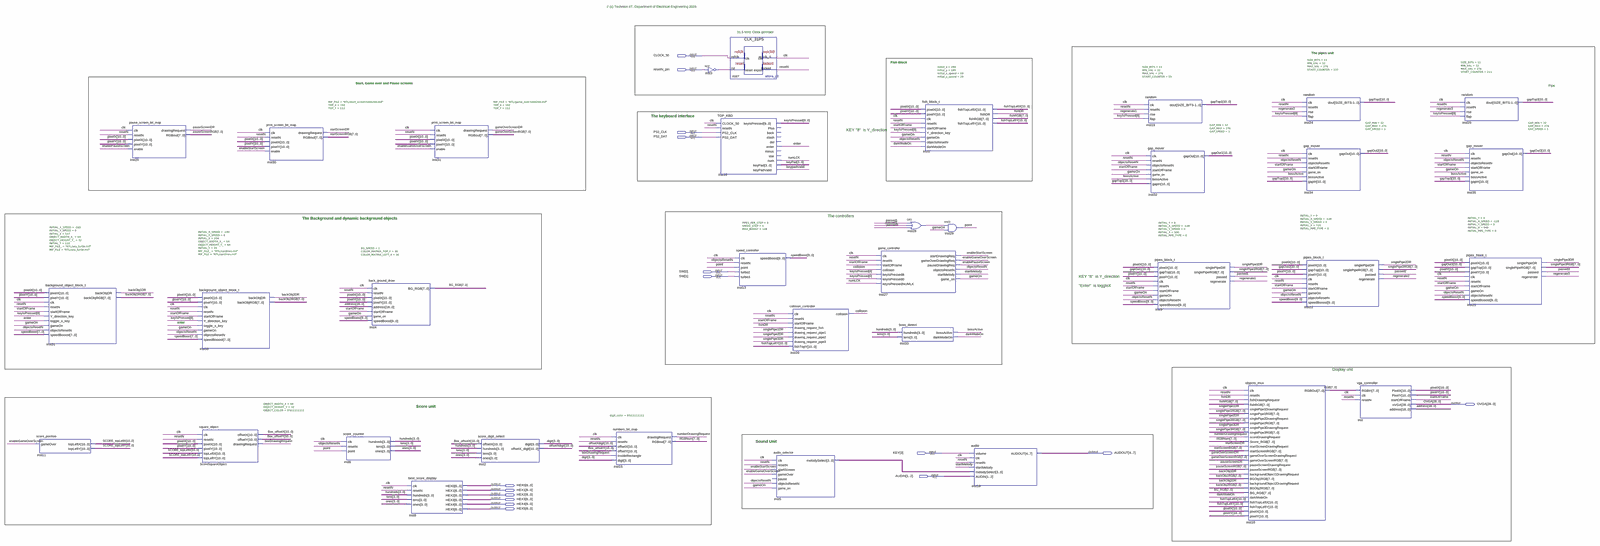
[diagram p0: schematic sheet, whole]
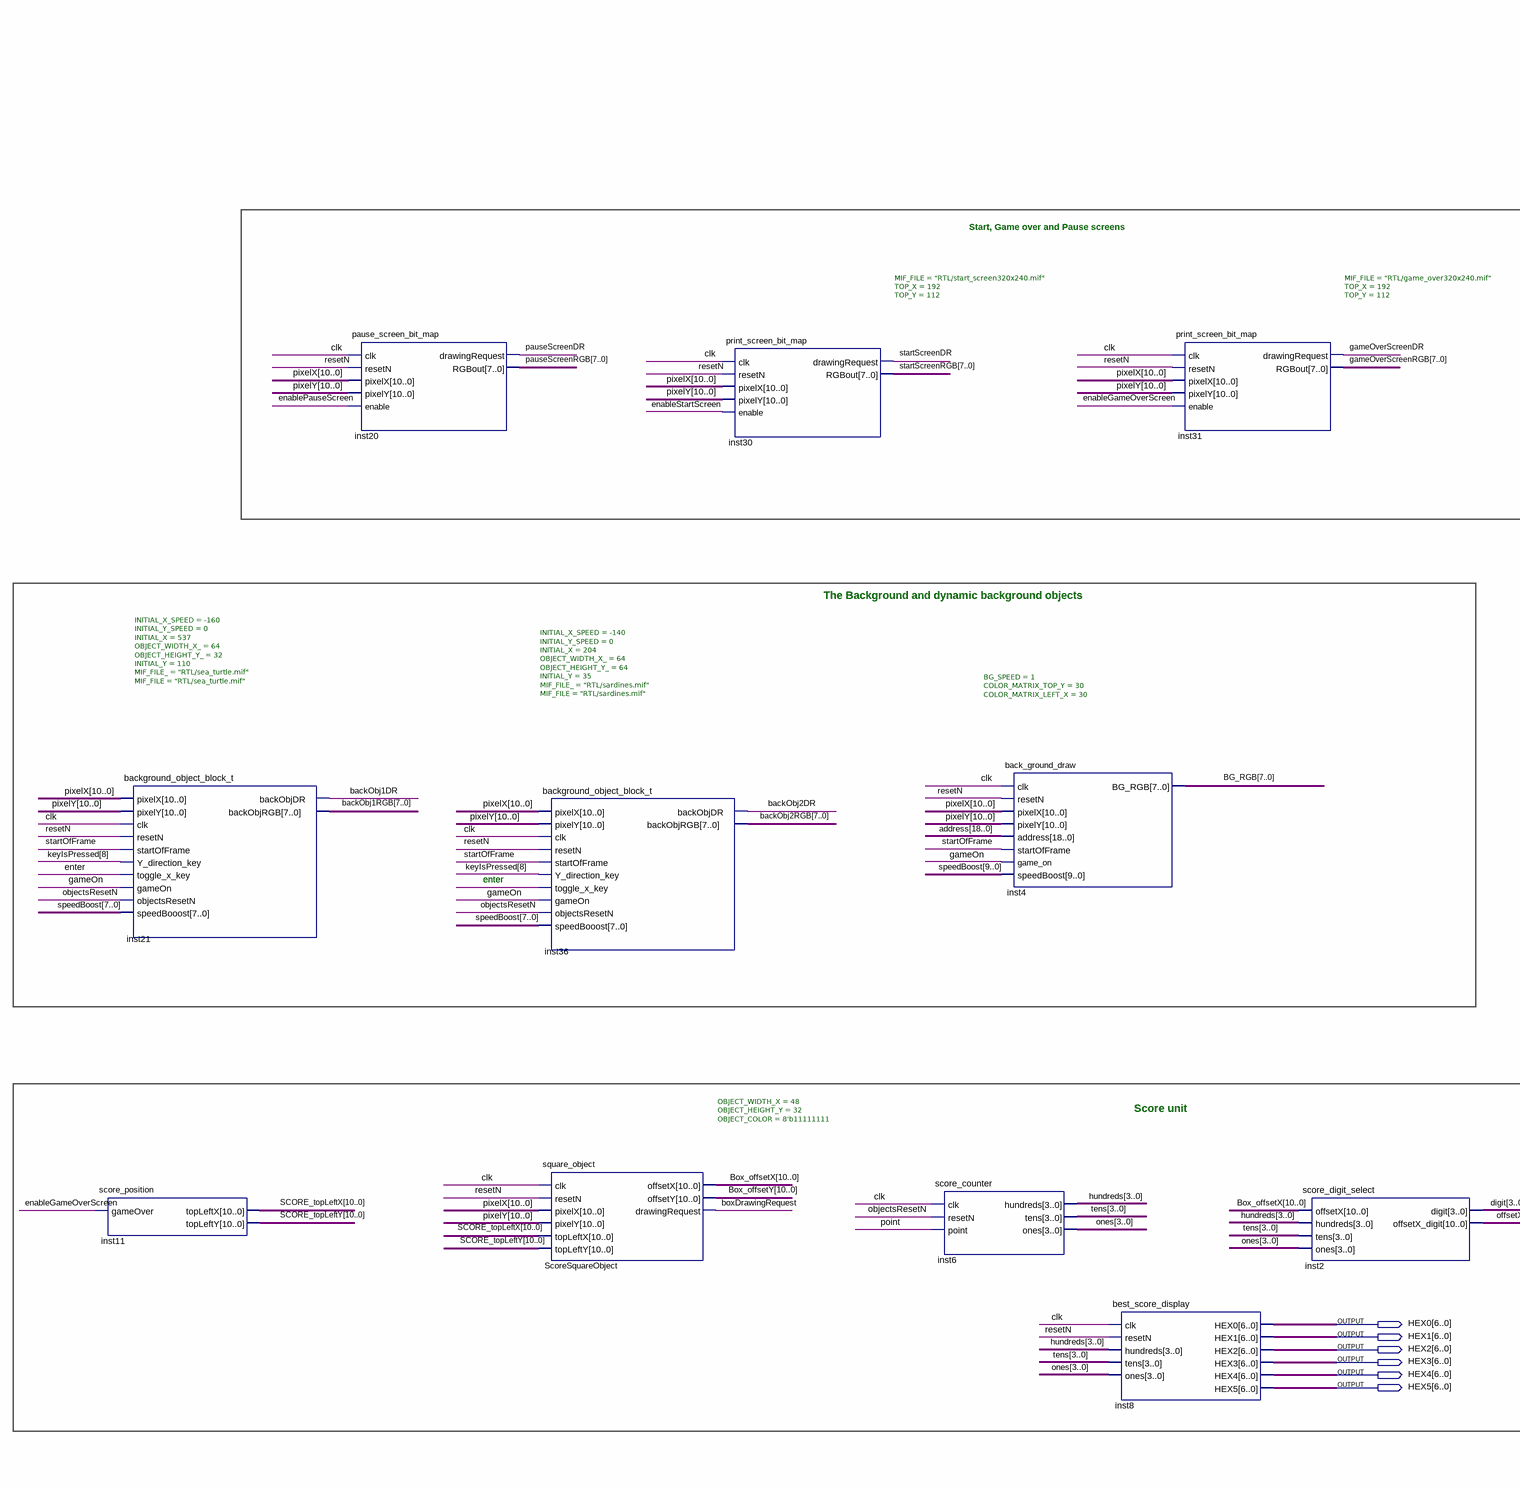
[diagram p1: schematic sheet, left part]
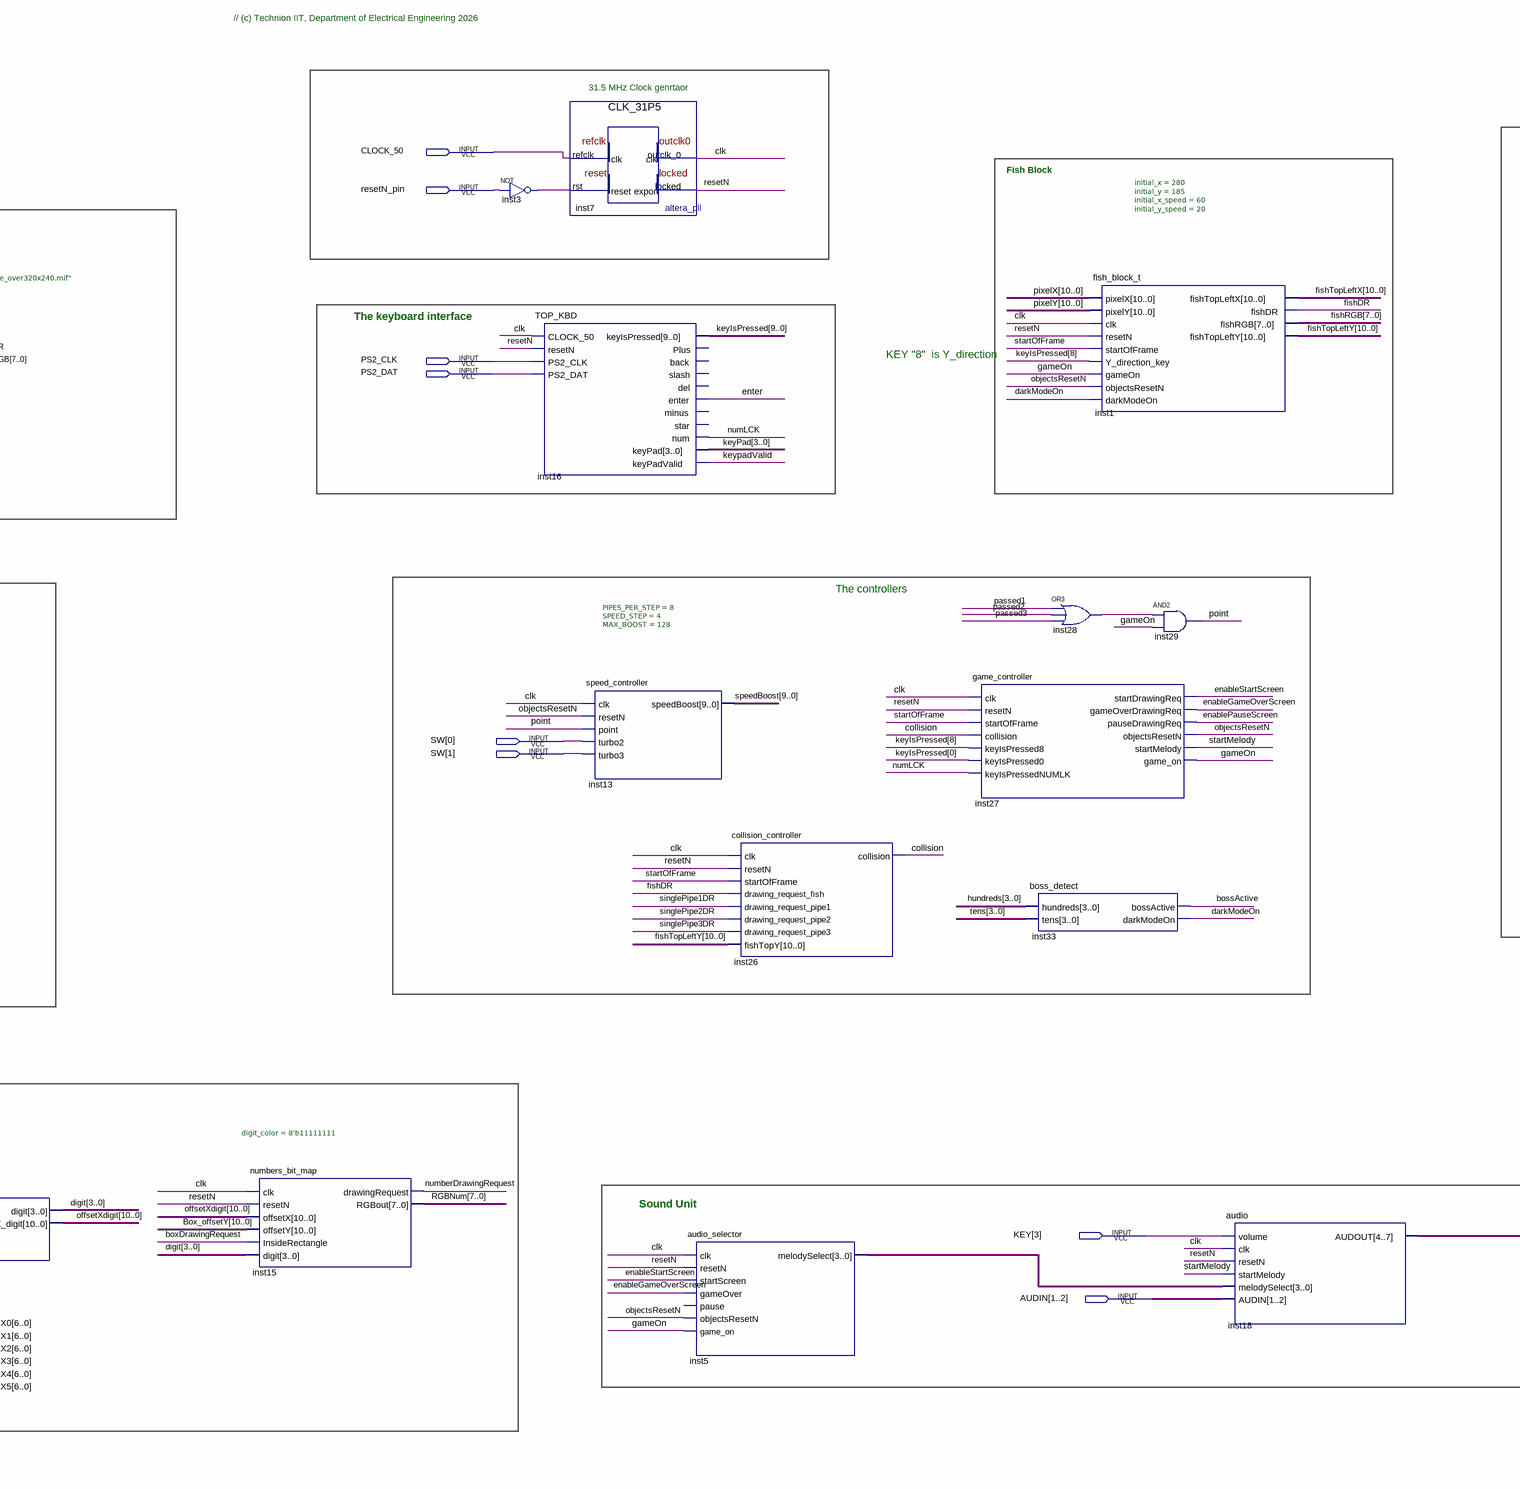
[diagram p2: schematic sheet, centre part]
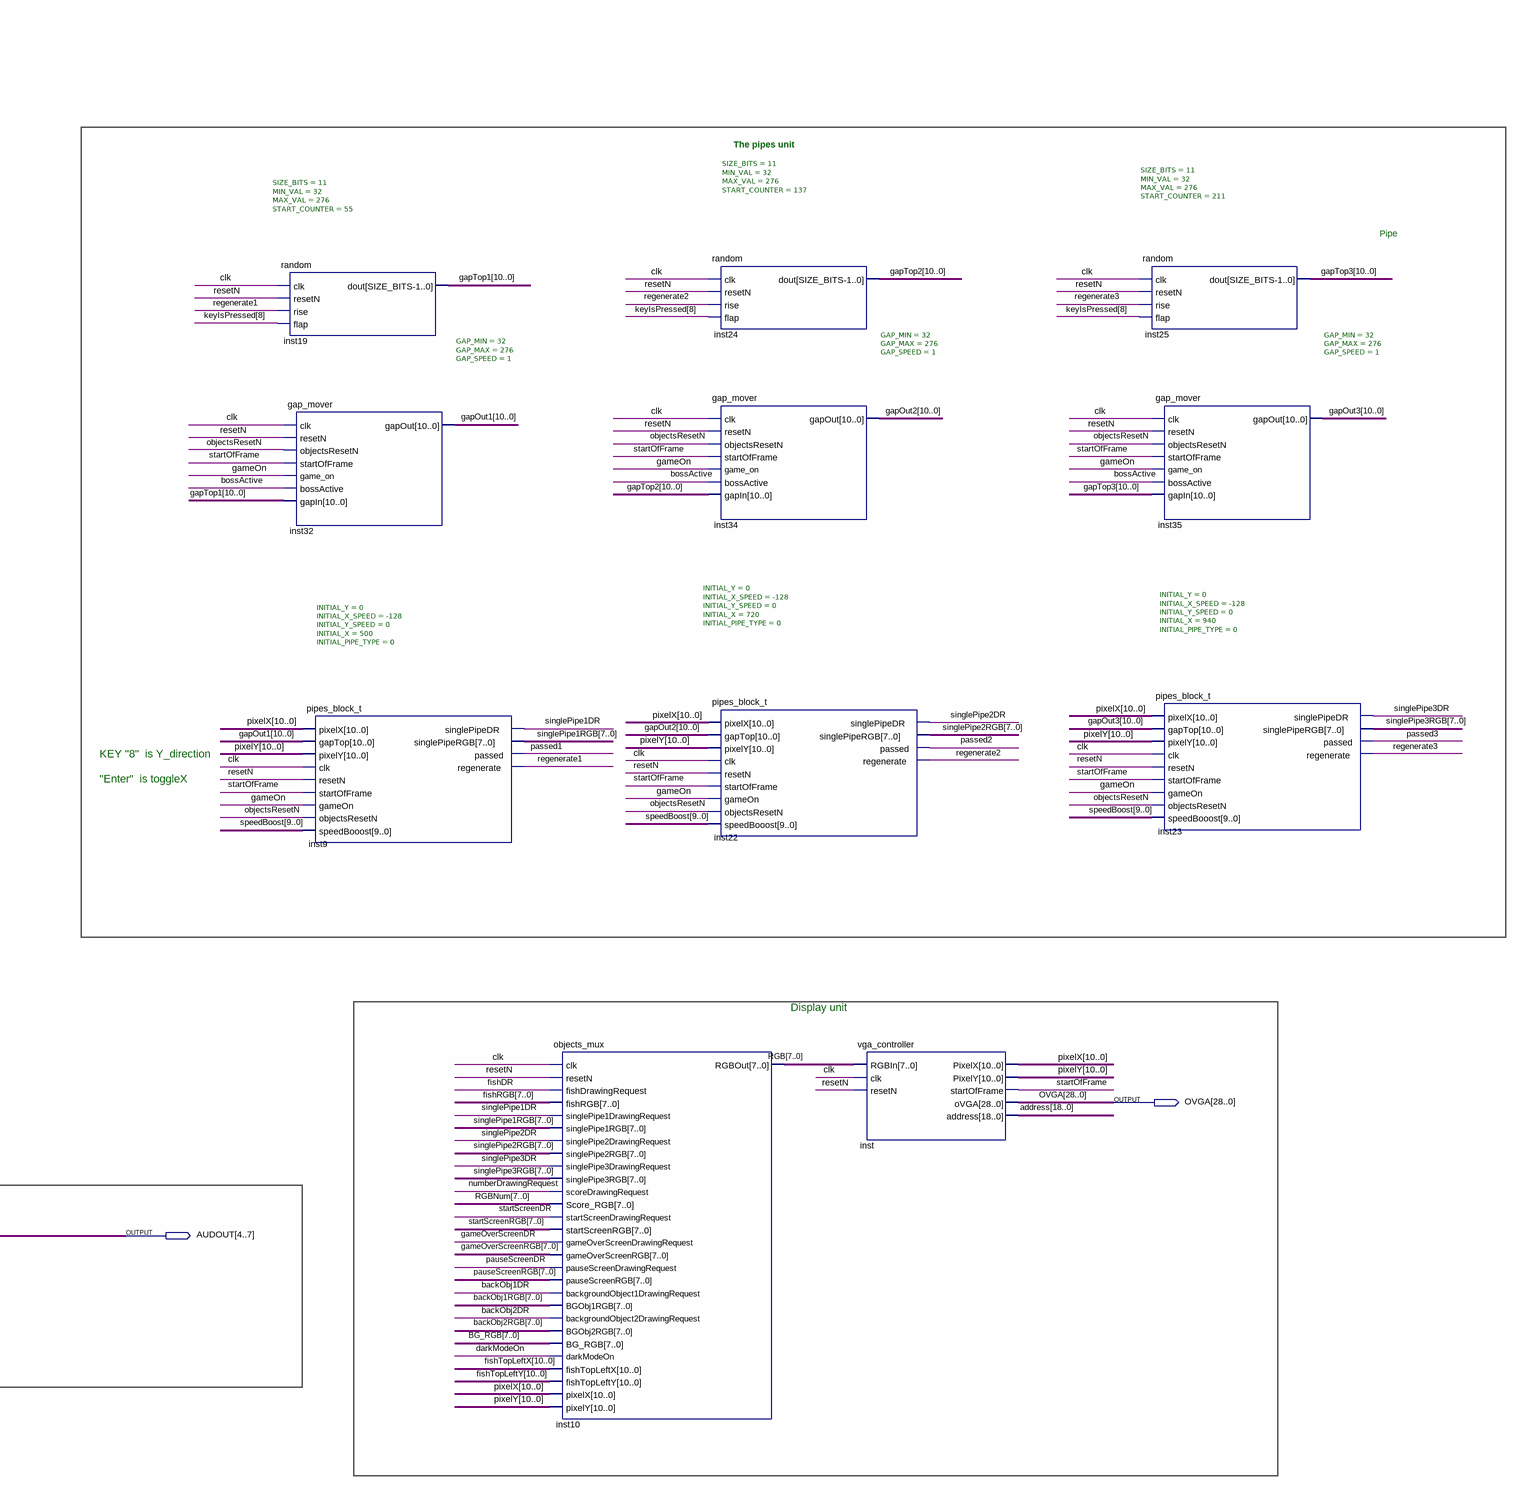
[diagram p3: schematic sheet, right part]
// Quartus schematic TOP_FLAPPY_FISH.bdf as structural Verilog: 35 symbols, 16 pins
module TOP_FLAPPY_FISH (
  input  CLOCK_50,
  input  resetN_pin,
  input  PS2_CLK,
  input  PS2_DAT,
  input  [1:0] SW,
  input  [3:3] KEY,
  input  [1:2] AUDIN,
  output [28:0] OVGA,
  output [4:7] AUDOUT,
  output [6:0] HEX0,
  output [6:0] HEX1,
  output [6:0] HEX2,
  output [6:0] HEX3,
  output [6:0] HEX4,
  output [6:0] HEX5
);

  wire backObj1DR, backObj2DR, bossActive, boxDrawingRequest, clk, collision, darkModeOn,
       enableGameOverScreen, enablePauseScreen, enableStartScreen, enter, fishDR, gameOn, gameOverScreenDR,
       inst3_out, inst28_out, keypadValid, numberDrawingRequest, numLCK, objectsResetN, passed1, passed2,
       passed3, pauseScreenDR, point, regenerate1, regenerate2, regenerate3, resetN, singlePipe1DR,
       singlePipe2DR, singlePipe3DR, startMelody, startOfFrame, startScreenDR;
  wire [3:0] digit, hundreds, inst5_melodyselect, keyPad, ones, tens;
  wire [7:0] backObj1RGB, backObj2RGB, BG_RGB, fishRGB, gameOverScreenRGB, pauseScreenRGB, RGB, RGBNum,
       singlePipe1RGB, singlePipe2RGB, singlePipe3RGB, startScreenRGB;
  wire [9:0] keyIsPressed, speedBoost;
  wire [10:0] Box_offsetX, Box_offsetY, fishTopLeftX, fishTopLeftY, gapOut1, gapOut2, gapOut3, gapTop1,
       gapTop2, gapTop3, offsetXdigit, pixelX, pixelY, SCORE_topLeftX, SCORE_topLeftY;
  wire [18:0] address;

  background_object_block_t #(.INITIAL_X_SPEED(-160), .INITIAL_Y_SPEED(0), .INITIAL_X(537), .OBJECT_WIDTH_X_(64), .OBJECT_HEIGHT_Y_(32), .INITIAL_Y(110), .MIF_FILE_("RTL/sea_turtle.mif"), .MIF_FILE("RTL/sea_turtle.mif")) inst21 (
    .pixelX(pixelX), .pixelY(pixelY), .clk(clk), .resetN(resetN), .startOfFrame(startOfFrame),
    .Y_direction_key(keyIsPressed[8]), .toggle_x_key(enter), .gameOn(gameOn), .objectsResetN(objectsResetN),
    .speedBooost(speedBoost[7:0]), .backObjDR(backObj1DR), .backObjRGB(backObj1RGB));
  score_position inst11 (.gameOver(enableGameOverScreen), .topLeftX(SCORE_topLeftX), .topLeftY(SCORE_topLeftY));
  pause_screen_bit_map inst20 (
    .clk(clk), .resetN(resetN), .pixelX(pixelX), .pixelY(pixelY), .enable(enablePauseScreen),
    .drawingRequest(pauseScreenDR), .RGBout(pauseScreenRGB));
  background_object_block_t #(.INITIAL_X_SPEED(-140), .INITIAL_Y_SPEED(0), .INITIAL_X(204), .OBJECT_WIDTH_X_(64), .OBJECT_HEIGHT_Y_(64), .INITIAL_Y(35), .MIF_FILE_("RTL/sardines.mif"), .MIF_FILE("RTL/sardines.mif")) inst36 (
    .pixelX(pixelX), .pixelY(pixelY), .clk(clk), .resetN(resetN), .startOfFrame(startOfFrame),
    .Y_direction_key(keyIsPressed[8]), .toggle_x_key(enter), .gameOn(gameOn), .objectsResetN(objectsResetN),
    .speedBooost(speedBoost[7:0]), .backObjDR(backObj2DR), .backObjRGB(backObj2RGB));
  square_object #(.OBJECT_WIDTH_X(48), .OBJECT_HEIGHT_Y(32), .OBJECT_COLOR(8'b11111111)) ScoreSquareObject (
    .clk(clk), .resetN(resetN), .pixelX(pixelX), .pixelY(pixelY), .topLeftX(SCORE_topLeftX),
    .topLeftY(SCORE_topLeftY), .offsetX(Box_offsetX), .offsetY(Box_offsetY),
    .drawingRequest(boxDrawingRequest));
  print_screen_bit_map #(.MIF_FILE("RTL/start_screen320x240.mif"), .TOP_X(192), .TOP_Y(112)) inst30 (
    .clk(clk), .resetN(resetN), .pixelX(pixelX), .pixelY(pixelY), .enable(enableStartScreen),
    .drawingRequest(startScreenDR), .RGBout(startScreenRGB));
  score_counter inst6 (.clk(clk), .resetN(objectsResetN), .point(point), .hundreds(hundreds), .tens(tens), .ones(ones));
  back_ground_draw #(.BG_SPEED(1), .COLOR_MATRIX_TOP_Y(30), .COLOR_MATRIX_LEFT_X(30)) inst4 (
    .clk(clk), .resetN(resetN), .pixelX(pixelX), .pixelY(pixelY), .address(address),
    .startOfFrame(startOfFrame), .game_on(gameOn), .speedBoost(speedBoost), .BG_RGB(BG_RGB));
  best_score_display inst8 (
    .clk(clk), .resetN(resetN), .hundreds(hundreds), .tens(tens), .ones(ones), .HEX0(HEX0), .HEX1(HEX1),
    .HEX2(HEX2), .HEX3(HEX3), .HEX4(HEX4), .HEX5(HEX5));
  print_screen_bit_map #(.MIF_FILE("RTL/game_over320x240.mif"), .TOP_X(192), .TOP_Y(112)) inst31 (
    .clk(clk), .resetN(resetN), .pixelX(pixelX), .pixelY(pixelY), .enable(enableGameOverScreen),
    .drawingRequest(gameOverScreenDR), .RGBout(gameOverScreenRGB));
  score_digit_select inst2 (
    .offsetX(Box_offsetX), .hundreds(hundreds), .tens(tens), .ones(ones), .digit(digit),
    .offsetX_digit(offsetXdigit));
  numbers_bit_map #(.digit_color(8'b11111111)) inst15 (
    .clk(clk), .resetN(resetN), .offsetX(offsetXdigit), .offsetY(Box_offsetY),
    .InsideRectangle(boxDrawingRequest), .digit(digit), .drawingRequest(numberDrawingRequest), .RGBout(RGBNum));
  not inst3 (inst3_out, resetN_pin);
  CLK_31P5 inst7 (.refclk(CLOCK_50), .rst(inst3_out), .outclk_0(clk), .locked(resetN));
  TOP_KBD inst16 (
    .CLOCK_50(clk), .resetN(resetN), .PS2_CLK(PS2_CLK), .PS2_DAT(PS2_DAT), .keyIsPressed(keyIsPressed),
    .enter(enter), .num(numLCK), .keyPad(keyPad), .keyPadValid(keypadValid));  // open: Plus, back, slash, del, minus, star
  speed_controller #(.PIPES_PER_STEP(8), .SPEED_STEP(4), .MAX_BOOST(128)) inst13 (
    .clk(clk), .resetN(objectsResetN), .point(point), .turbo2(SW[0]), .turbo3(SW[1]), .speedBoost(speedBoost));
  collision_controller inst26 (
    .clk(clk), .resetN(resetN), .startOfFrame(startOfFrame), .drawing_request_fish(fishDR),
    .drawing_request_pipe1(singlePipe1DR), .drawing_request_pipe2(singlePipe2DR),
    .drawing_request_pipe3(singlePipe3DR), .fishTopY(fishTopLeftY), .collision(collision));
  audio_selector inst5 (
    .clk(clk), .resetN(resetN), .startScreen(enableStartScreen), .gameOver(enableGameOverScreen),
    .objectsResetN(objectsResetN), .game_on(gameOn), .melodySelect(inst5_melodyselect));  // open: pause
  game_controller inst27 (
    .clk(clk), .resetN(resetN), .startOfFrame(startOfFrame), .collision(collision),
    .keyIsPressed8(keyIsPressed[8]), .keyIsPressed0(keyIsPressed[0]), .keyIsPressedNUMLK(numLCK),
    .startDrawingReq(enableStartScreen), .gameOverDrawingReq(enableGameOverScreen),
    .pauseDrawingReq(enablePauseScreen), .objectsResetN(objectsResetN), .startMelody(startMelody),
    .game_on(gameOn));
  boss_detect inst33 (.hundreds(hundreds), .tens(tens), .bossActive(bossActive), .darkModeOn(darkModeOn));
  or inst28 (inst28_out, passed1, passed2, passed3);
  fish_block_t #(.initial_x(280), .initial_y(185), .initial_x_speed(60), .initial_y_speed(20)) inst1 (
    .pixelX(pixelX), .pixelY(pixelY), .clk(clk), .resetN(resetN), .startOfFrame(startOfFrame),
    .Y_direction_key(keyIsPressed[8]), .gameOn(gameOn), .objectsResetN(objectsResetN),
    .darkModeOn(darkModeOn), .fishTopLeftX(fishTopLeftX), .fishDR(fishDR), .fishRGB(fishRGB),
    .fishTopLeftY(fishTopLeftY));
  and inst29 (point, inst28_out, gameOn);
  audio inst18 (
    .volume(KEY[3]), .clk(clk), .resetN(resetN), .startMelody(startMelody),
    .melodySelect(inst5_melodyselect), .AUDIN(AUDIN), .AUDOUT(AUDOUT));
  random #(.SIZE_BITS(11), .MIN_VAL(32), .MAX_VAL(276), .START_COUNTER(55)) inst19 (
    .clk(clk), .resetN(resetN), .rise(regenerate1), .flap(keyIsPressed[8]), .dout(gapTop1));
  gap_mover #(.GAP_MIN(32), .GAP_MAX(276), .GAP_SPEED(1)) inst32 (
    .clk(clk), .resetN(resetN), .objectsResetN(objectsResetN), .startOfFrame(startOfFrame), .game_on(gameOn),
    .bossActive(bossActive), .gapIn(gapTop1), .gapOut(gapOut1));
  pipes_block_t #(.INITIAL_Y(0), .INITIAL_X_SPEED(-128), .INITIAL_Y_SPEED(0), .INITIAL_X(500), .INITIAL_PIPE_TYPE(0)) inst9 (
    .pixelX(pixelX), .gapTop(gapOut1), .pixelY(pixelY), .clk(clk), .resetN(resetN),
    .startOfFrame(startOfFrame), .gameOn(gameOn), .objectsResetN(objectsResetN), .speedBooost(speedBoost),
    .singlePipeDR(singlePipe1DR), .singlePipeRGB(singlePipe1RGB), .passed(passed1), .regenerate(regenerate1));
  objects_mux inst10 (
    .clk(clk), .resetN(resetN), .fishDrawingRequest(fishDR), .fishRGB(fishRGB),
    .singlePipe1DrawingRequest(singlePipe1DR), .singlePipe1RGB(singlePipe1RGB),
    .singlePipe2DrawingRequest(singlePipe2DR), .singlePipe2RGB(singlePipe2RGB),
    .singlePipe3DrawingRequest(singlePipe3DR), .singlePipe3RGB(singlePipe3RGB),
    .scoreDrawingRequest(numberDrawingRequest), .Score_RGB(RGBNum),
    .startScreenDrawingRequest(startScreenDR), .startScreenRGB(startScreenRGB),
    .gameOverScreenDrawingRequest(gameOverScreenDR), .gameOverScreenRGB(gameOverScreenRGB),
    .pauseScreenDrawingRequest(pauseScreenDR), .pauseScreenRGB(pauseScreenRGB),
    .backgroundObject1DrawingRequest(backObj1DR), .BGObj1RGB(backObj1RGB),
    .backgroundObject2DrawingRequest(backObj2DR), .BGObj2RGB(backObj2RGB), .BG_RGB(BG_RGB),
    .darkModeOn(darkModeOn), .fishTopLeftX(fishTopLeftX), .fishTopLeftY(fishTopLeftY), .pixelX(pixelX),
    .pixelY(pixelY), .RGBOut(RGB));
  random #(.SIZE_BITS(11), .MIN_VAL(32), .MAX_VAL(276), .START_COUNTER(137)) inst24 (
    .clk(clk), .resetN(resetN), .rise(regenerate2), .flap(keyIsPressed[8]), .dout(gapTop2));
  gap_mover #(.GAP_MIN(32), .GAP_MAX(276), .GAP_SPEED(1)) inst34 (
    .clk(clk), .resetN(resetN), .objectsResetN(objectsResetN), .startOfFrame(startOfFrame), .game_on(gameOn),
    .bossActive(bossActive), .gapIn(gapTop2), .gapOut(gapOut2));
  pipes_block_t #(.INITIAL_Y(0), .INITIAL_X_SPEED(-128), .INITIAL_Y_SPEED(0), .INITIAL_X(720), .INITIAL_PIPE_TYPE(0)) inst22 (
    .pixelX(pixelX), .gapTop(gapOut2), .pixelY(pixelY), .clk(clk), .resetN(resetN),
    .startOfFrame(startOfFrame), .gameOn(gameOn), .objectsResetN(objectsResetN), .speedBooost(speedBoost),
    .singlePipeDR(singlePipe2DR), .singlePipeRGB(singlePipe2RGB), .passed(passed2), .regenerate(regenerate2));
  vga_controller inst (
    .RGBIn(RGB), .clk(clk), .resetN(resetN), .PixelX(pixelX), .PixelY(pixelY), .startOfFrame(startOfFrame),
    .oVGA(OVGA), .address(address));
  random #(.SIZE_BITS(11), .MIN_VAL(32), .MAX_VAL(276), .START_COUNTER(211)) inst25 (
    .clk(clk), .resetN(resetN), .rise(regenerate3), .flap(keyIsPressed[8]), .dout(gapTop3));
  gap_mover #(.GAP_MIN(32), .GAP_MAX(276), .GAP_SPEED(1)) inst35 (
    .clk(clk), .resetN(resetN), .objectsResetN(objectsResetN), .startOfFrame(startOfFrame), .game_on(gameOn),
    .bossActive(bossActive), .gapIn(gapTop3), .gapOut(gapOut3));
  pipes_block_t #(.INITIAL_Y(0), .INITIAL_X_SPEED(-128), .INITIAL_Y_SPEED(0), .INITIAL_X(940), .INITIAL_PIPE_TYPE(0)) inst23 (
    .pixelX(pixelX), .gapTop(gapOut3), .pixelY(pixelY), .clk(clk), .resetN(resetN),
    .startOfFrame(startOfFrame), .gameOn(gameOn), .objectsResetN(objectsResetN), .speedBooost(speedBoost),
    .singlePipeDR(singlePipe3DR), .singlePipeRGB(singlePipe3RGB), .passed(passed3), .regenerate(regenerate3));

  // Notes on the sheet:
  //   // (c) Technion IIT, Department of Electrical Engineering 2026
  //   31.5 MHz Clock genrtaor
  //   The pipes unit
  //   Fish Block
  //   Start, Game over and Pause screens
  //   Pipe
  //   The keyboard interface
  //   KEY "8"  is Y_direction
  //   The controllers
  //   The Background and dynamic background objects
  //   KEY "8"  is Y_direction
  //   "Enter"  is toggleX
  //   enter
  //   Display unit
  //   Score unit
  //   Sound Unit
endmodule
